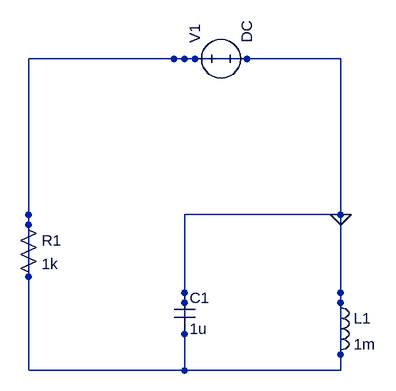
[diagram p0: schematic netlist2.asc]
netlist2.asc, the LTspice schematic file:
Version 4
SHEET 1 680 480
SYMBOL voltage 480 240 R270
SYMATTR InstName V1
SYMATTR Value DC
FLAG 720 480 0
SYMBOL res 224 480 R0
SYMATTR InstName R1
SYMATTR Value 1k
SYMBOL cap 464 600 R0
SYMATTR InstName C1
SYMATTR Value 1u
SYMBOL ind 704 600 R0
SYMATTR InstName L1
SYMATTR Value 1m
WIRE 240 240 480 240
WIRE 240 496 240 240
WIRE 480 600 480 720
WIRE 720 616 720 480
WIRE 720 240 464 240
WIRE 720 240 720 480
WIRE 240 720 240 480
WIRE 240 720 480 720
WIRE 480 480 720 480
WIRE 480 480 480 616
WIRE 720 720 480 720
WIRE 720 720 720 600

The netlist it stands for:
* netlist2.asc
V1 0 0 DC
R1 0 0 1k
C1 0 0 1u
L1 0 0 1m
.backanno
.end